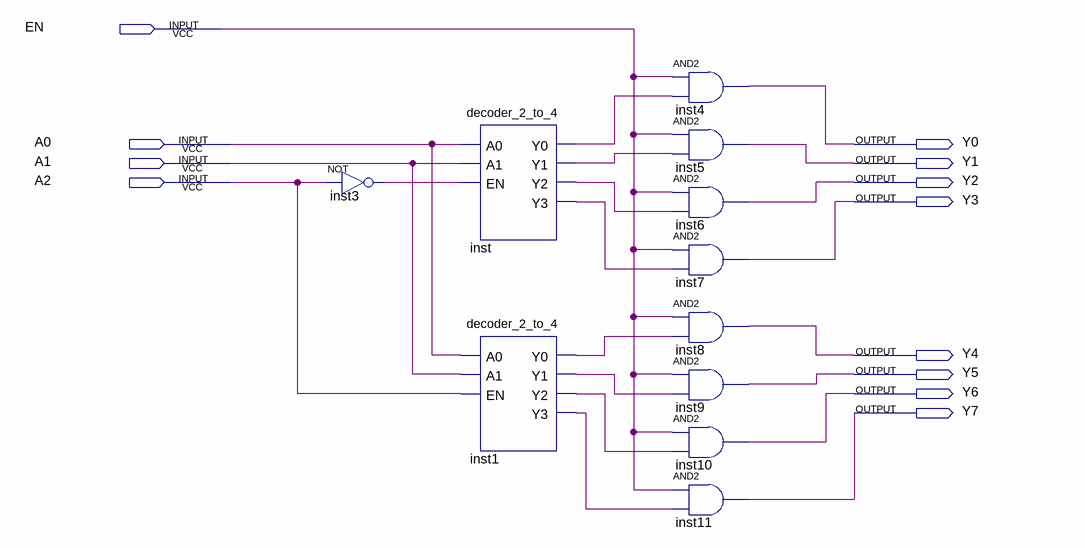
[diagram p0: schematic sheet]
// Quartus schematic decoder_3_to_8.bdf as structural Verilog: 11 symbols, 12 pins
module decoder_3_to_8 (
  input  EN,
  input  A0,
  input  A1,
  input  A2,
  output Y0,
  output Y1,
  output Y2,
  output Y3,
  output Y4,
  output Y5,
  output Y6,
  output Y7
);

  wire inst1_y0, inst1_y1, inst1_y2, inst1_y3, inst3_out, inst_y0, inst_y1, inst_y2, inst_y3;

  not inst3 (inst3_out, A2);
  decoder_2_to_4 inst (.A0(A0), .A1(A1), .EN(inst3_out), .Y0(inst_y0), .Y1(inst_y1), .Y2(inst_y2), .Y3(inst_y3));
  decoder_2_to_4 inst1 (.A0(A0), .A1(A1), .EN(A2), .Y0(inst1_y0), .Y1(inst1_y1), .Y2(inst1_y2), .Y3(inst1_y3));
  and inst4 (Y0, EN, inst_y0);
  and inst5 (Y1, EN, inst_y1);
  and inst6 (Y2, EN, inst_y2);
  and inst7 (Y3, EN, inst_y3);
  and inst8 (Y4, EN, inst1_y0);
  and inst9 (Y5, EN, inst1_y1);
  and inst10 (Y6, EN, inst1_y2);
  and inst11 (Y7, EN, inst1_y3);
endmodule
